# Altium schematic sheet RPull_Section.SchDoc
size A4; SheetNumber: 10
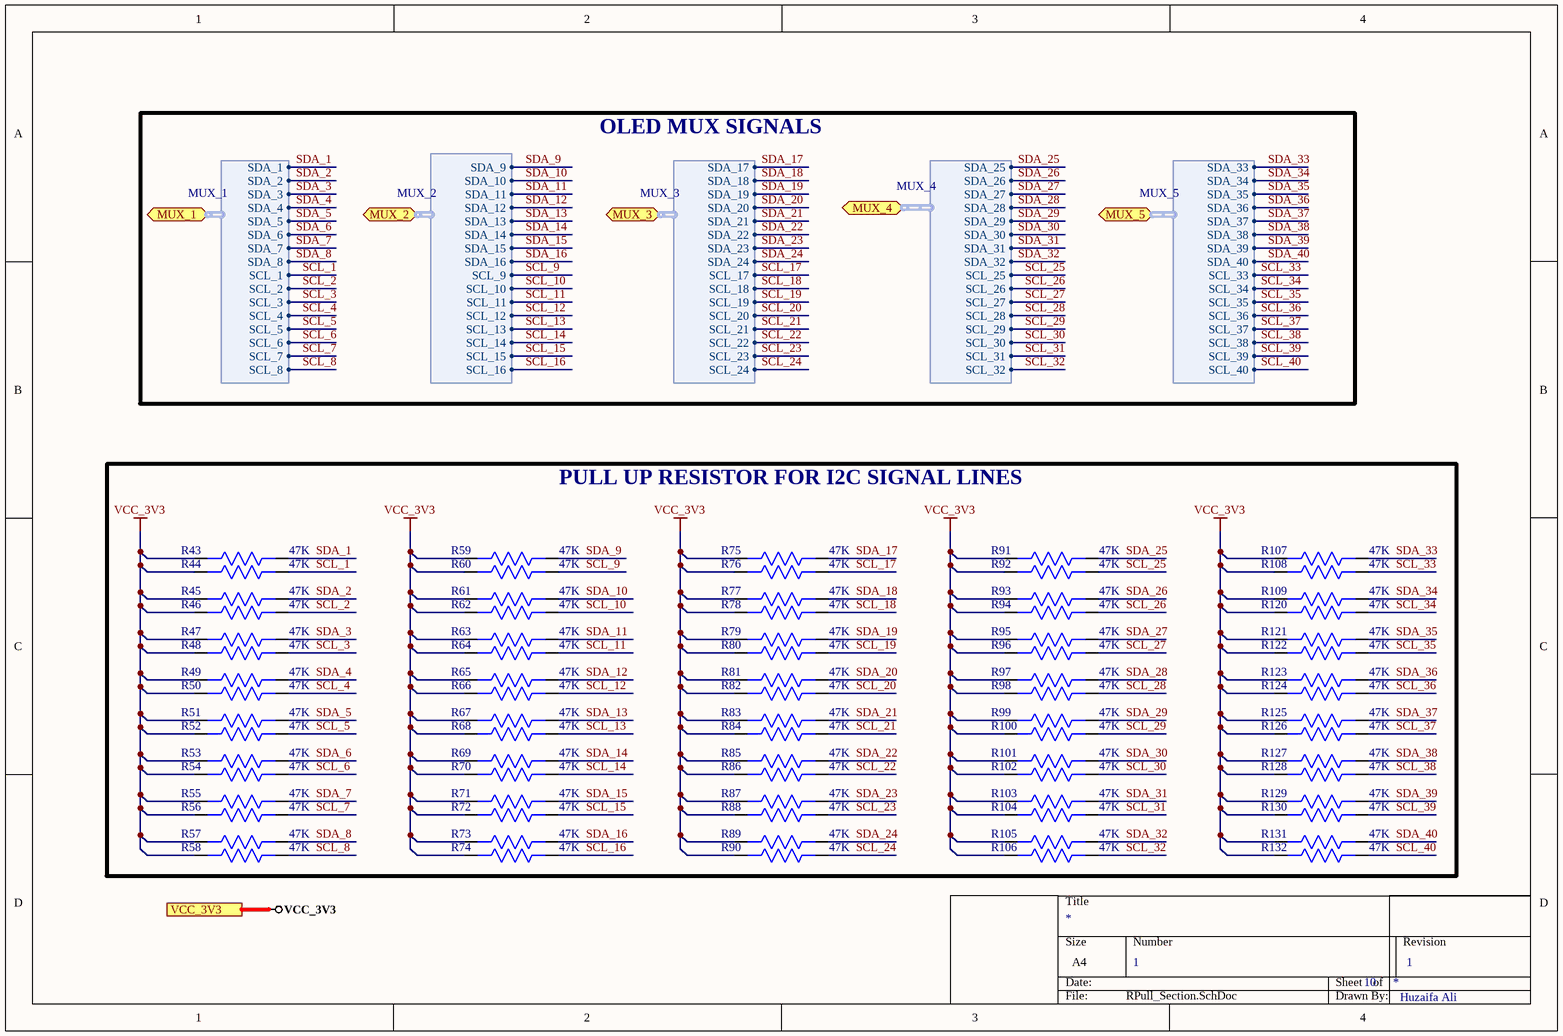
[diagram p0: RPull_Section.SchDoc]

## Parts
R43  47K  [Res0402]
R44  47K  [Res0402]
R45  47K  [Res0402]
R46  47K  [Res0402]
R47  47K  [Res0402]
R48  47K  [Res0402]
R49  47K  [Res0402]
R50  47K  [Res0402]
R51  47K  [Res0402]
R52  47K  [Res0402]
R53  47K  [Res0402]
R54  47K  [Res0402]
R55  47K  [Res0402]
R56  47K  [Res0402]
R57  47K  [Res0402]
R58  47K  [Res0402]
R59  47K  [Res0402]
R60  47K  [Res0402]
R61  47K  [Res0402]
R62  47K  [Res0402]
R63  47K  [Res0402]
R64  47K  [Res0402]
R65  47K  [Res0402]
R66  47K  [Res0402]
R67  47K  [Res0402]
R68  47K  [Res0402]
R69  47K  [Res0402]
R70  47K  [Res0402]
R71  47K  [Res0402]
R72  47K  [Res0402]
R73  47K  [Res0402]
R74  47K  [Res0402]
R75  47K  [Res0402]
R76  47K  [Res0402]
R77  47K  [Res0402]
R78  47K  [Res0402]
R79  47K  [Res0402]
R80  47K  [Res0402]
R81  47K  [Res0402]
R82  47K  [Res0402]
R83  47K  [Res0402]
R84  47K  [Res0402]
R85  47K  [Res0402]
R86  47K  [Res0402]
R87  47K  [Res0402]
R88  47K  [Res0402]
R89  47K  [Res0402]
R90  47K  [Res0402]
R91  47K  [Res0402]
R92  47K  [Res0402]
R93  47K  [Res0402]
R94  47K  [Res0402]
R95  47K  [Res0402]
R96  47K  [Res0402]
R97  47K  [Res0402]
R98  47K  [Res0402]
R99  47K  [Res0402]
R100  47K  [Res0402]
R101  47K  [Res0402]
R102  47K  [Res0402]
R103  47K  [Res0402]
R104  47K  [Res0402]
R105  47K  [Res0402]
R106  47K  [Res0402]
R107  47K  [Res0402]
R108  47K  [Res0402]
R109  47K  [Res0402]
R120  47K  [Res0402]
R121  47K  [Res0402]
R122  47K  [Res0402]
R123  47K  [Res0402]
R124  47K  [Res0402]
R125  47K  [Res0402]
R126  47K  [Res0402]
R127  47K  [Res0402]
R128  47K  [Res0402]
R129  47K  [Res0402]
R130  47K  [Res0402]
R131  47K  [Res0402]
R132  47K  [Res0402]

## Blocks framed on the sheet
PULL UP RESISTOR FOR I2C SIGNAL LINES: R43-R109 R120-R132

## Ports
MUX_1 (bidir, harness MUX_1), MUX_2 (bidir, harness MUX_2), MUX_3 (bidir, harness MUX_3), MUX_4 (bidir, harness MUX_4), MUX_5 (bidir, harness MUX_5), VCC_3V3

## Harnesses
MUX_4: SDA_25, SDA_26, SDA_27, SDA_28, SDA_29, SDA_30, SDA_31, SDA_32, SCL_25, SCL_26, SCL_27, SCL_28, SCL_29, SCL_30, SCL_31, SCL_32
MUX_5: SDA_33, SDA_34, SDA_35, SDA_36, SDA_37, SDA_38, SDA_39, SDA_40, SCL_33, SCL_34, SCL_35, SCL_36, SCL_37, SCL_38, SCL_39, SCL_40
MUX_1: SDA_1, SDA_2, SDA_3, SDA_4, SDA_5, SDA_6, SDA_7, SDA_8, SCL_1, SCL_2, SCL_3, SCL_4, SCL_5, SCL_6, SCL_7, SCL_8
MUX_2: SDA_9, SDA_10, SDA_11, SDA_12, SDA_13, SDA_14, SDA_15, SDA_16, SCL_9, SCL_10, SCL_11, SCL_12, SCL_13, SCL_14, SCL_15, SCL_16
MUX_3: SDA_17, SDA_18, SDA_19, SDA_20, SDA_21, SDA_22, SDA_23, SDA_24, SCL_17, SCL_18, SCL_19, SCL_20, SCL_21, SCL_22, SCL_23, SCL_24

## Nets
VCC_3V3: R43.2 R44.2 R45.2 R46.2 R47.2 R48.2 R49.2 R50.2 R51.2 R52.2 R53.2 R54.2 R55.2 R56.2 R57.2 R58.2 R59.2 R60.2 R61.2 R62.2 R63.2 R64.2 R65.2 R66.2 R67.2 R68.2 R69.2 R70.2 R71.2 R72.2 R73.2 R74.2 R75.2 R76.2 R77.2 R78.2 R79.2 R80.2 R81.2 R82.2 R83.2 R84.2 R85.2 R86.2 R87.2 R88.2 R89.2 R90.2 R91.2 R92.2 R93.2 R94.2 R95.2 R96.2 R97.2 R98.2 R99.2 R100.2 R101.2 R102.2 R103.2 R104.2 R105.2 R106.2 R107.2 R108.2 R109.2 R120.2 R121.2 R122.2 R123.2 R124.2 R125.2 R126.2 R127.2 R128.2 R129.2 R130.2 R131.2 R132.2 ; port VCC_3V3
SCL_1: R44.1 ; port MUX_1.SCL_1
SCL_2: R46.1 ; port MUX_1.SCL_2
SCL_3: R48.1 ; port MUX_1.SCL_3
SCL_4: R50.1 ; port MUX_1.SCL_4
SCL_5: R52.1 ; port MUX_1.SCL_5
SCL_6: R54.1 ; port MUX_1.SCL_6
SCL_7: R56.1 ; port MUX_1.SCL_7
SCL_8: R58.1 ; port MUX_1.SCL_8
SCL_9: R60.1 ; port MUX_2.SCL_9
SCL_10: R62.1 ; port MUX_2.SCL_10
SCL_11: R64.1 ; port MUX_2.SCL_11
SCL_12: R66.1 ; port MUX_2.SCL_12
SCL_13: R68.1 ; port MUX_2.SCL_13
SCL_14: R70.1 ; port MUX_2.SCL_14
SCL_15: R72.1 ; port MUX_2.SCL_15
SCL_16: R74.1 ; port MUX_2.SCL_16
SCL_17: R76.1 ; port MUX_3.SCL_17
SCL_18: R78.1 ; port MUX_3.SCL_18
SCL_19: R80.1 ; port MUX_3.SCL_19
SCL_20: R82.1 ; port MUX_3.SCL_20
SCL_21: R84.1 ; port MUX_3.SCL_21
SCL_22: R86.1 ; port MUX_3.SCL_22
SCL_23: R88.1 ; port MUX_3.SCL_23
SCL_24: R90.1 ; port MUX_3.SCL_24
SCL_25: R92.1 ; port MUX_4.SCL_25
SCL_26: R94.1 ; port MUX_4.SCL_26
SCL_27: R96.1 ; port MUX_4.SCL_27
SCL_28: R98.1 ; port MUX_4.SCL_28
SCL_29: R100.1 ; port MUX_4.SCL_29
SCL_30: R102.1 ; port MUX_4.SCL_30
SCL_31: R104.1 ; port MUX_4.SCL_31
SCL_32: R106.1 ; port MUX_4.SCL_32
SCL_33: R108.1 ; port MUX_5.SCL_33
SCL_34: R120.1 ; port MUX_5.SCL_34
SCL_35: R122.1 ; port MUX_5.SCL_35
SCL_36: R124.1 ; port MUX_5.SCL_36
SCL_37: R126.1 ; port MUX_5.SCL_37
SCL_38: R128.1 ; port MUX_5.SCL_38
SCL_39: R130.1 ; port MUX_5.SCL_39
SCL_40: R132.1 ; port MUX_5.SCL_40
SDA_1: R43.1 ; port MUX_1.SDA_1
SDA_2: R45.1 ; port MUX_1.SDA_2
SDA_3: R47.1 ; port MUX_1.SDA_3
SDA_4: R49.1 ; port MUX_1.SDA_4
SDA_5: R51.1 ; port MUX_1.SDA_5
SDA_6: R53.1 ; port MUX_1.SDA_6
SDA_7: R55.1 ; port MUX_1.SDA_7
SDA_8: R57.1 ; port MUX_1.SDA_8
SDA_9: R59.1 ; port MUX_2.SDA_9
SDA_10: R61.1 ; port MUX_2.SDA_10
SDA_11: R63.1 ; port MUX_2.SDA_11
SDA_12: R65.1 ; port MUX_2.SDA_12
SDA_13: R67.1 ; port MUX_2.SDA_13
SDA_14: R69.1 ; port MUX_2.SDA_14
SDA_15: R71.1 ; port MUX_2.SDA_15
SDA_16: R73.1 ; port MUX_2.SDA_16
SDA_17: R75.1 ; port MUX_3.SDA_17
SDA_18: R77.1 ; port MUX_3.SDA_18
SDA_19: R79.1 ; port MUX_3.SDA_19
SDA_20: R81.1 ; port MUX_3.SDA_20
SDA_21: R83.1 ; port MUX_3.SDA_21
SDA_22: R85.1 ; port MUX_3.SDA_22
SDA_23: R87.1 ; port MUX_3.SDA_23
SDA_24: R89.1 ; port MUX_3.SDA_24
SDA_25: R91.1 ; port MUX_4.SDA_25
SDA_26: R93.1 ; port MUX_4.SDA_26
SDA_27: R95.1 ; port MUX_4.SDA_27
SDA_28: R97.1 ; port MUX_4.SDA_28
SDA_29: R99.1 ; port MUX_4.SDA_29
SDA_30: R101.1 ; port MUX_4.SDA_30
SDA_31: R103.1 ; port MUX_4.SDA_31
SDA_32: R105.1 ; port MUX_4.SDA_32
SDA_33: R107.1 ; port MUX_5.SDA_33
SDA_34: R109.1 ; port MUX_5.SDA_34
SDA_35: R121.1 ; port MUX_5.SDA_35
SDA_36: R123.1 ; port MUX_5.SDA_36
SDA_37: R125.1 ; port MUX_5.SDA_37
SDA_38: R127.1 ; port MUX_5.SDA_38
SDA_39: R129.1 ; port MUX_5.SDA_39
SDA_40: R131.1 ; port MUX_5.SDA_40

## Notes on the sheet
- OLED MUX SIGNALS
- 1
- Huzaifa Ali

## Library data of the parts
R43-R109 R120-R132 = RC0402FR-0747KL: RES SMD 47K OHM 1% 1/16W 0402; Manufacturer: Yageo; Power Rating: 62.5mW; Temperature Coefficient: 100ppm/°C; Voltage Rating: 50V; Resistance: 47kR; Max Power Dissipation: 63mW; Supplier 1: Digi-Key; Manufacturer Part Number: RC0402FR-0747KL; Stock 1: 0; Pricing 1: 1=0.1, 10=0.016, 100=0.0064, 1000=0.00289, 2500=0.00251, 5000=0.00207 (USD); Case/Package: 0402; Case Code (Imperial): 0402; Case Code (Metric): 1005; Min Operating Temperature: -55°C; Max Operating Temperature: 155°C; Tolerance: 1%; Packaging: Tape and Reel; Package Quantity: 1; Termination: SMD/SMT; Composition: Thick Film; Number of Terminations: 2; Military Standard: Not; Features: Moisture Resistant; Length: 1mm; Height: 0.016inch; Depth: 0.5mm; Width: 0.5mm; REACH SVHC: Unknown; Lead Free: Lead Free; ComponentLink1URL: http://www.yageo.com/documents/recent/PYu-RC0402_51_RoHS_L_6_r.pdf?src-supplier=Future+Electronics; ComponentLink1Description: http://www.yageo.com/documents/recent/PYu-RC0402_51_RoHS_L_6_r.pdf?src-supplier=Future+Electronics; ComponentLink2URL: http://www.farnell.com/datasheets/1018594.pdf?src-supplier=Element14; ComponentLink2Description: http://www.farnell.com/datasheets/1018594.pdf?src-supplier=Element14; ComponentLink3URL: https://www.verical.com/server-webapp/html/getDatasheet?partID=323748&src-supplier=Verical; ComponentLink3Description: https://www.verical.com/server-webapp/html/getDatasheet?partID=323748&src-supplier=Verical; ComponentLink4URL: http://www.yageo.com/documents/recent/PYu-RC_Group_51_RoHS_L_10.pdf?src-supplier=Digi-Key; ComponentLink4Description: http://www.yageo.com/documents/recent/PYu-RC_Group_51_RoHS_L_10.pdf?src-supplier=Digi-Key; Supplier Part Number 1: 311-47.0KLRDKR-ND